# Altium schematic sheet Ethernet_Sheet.SchDoc (part 1 of 2)
size 420 x 297 mm; SheetNumber: 9; SheetTotal: 9
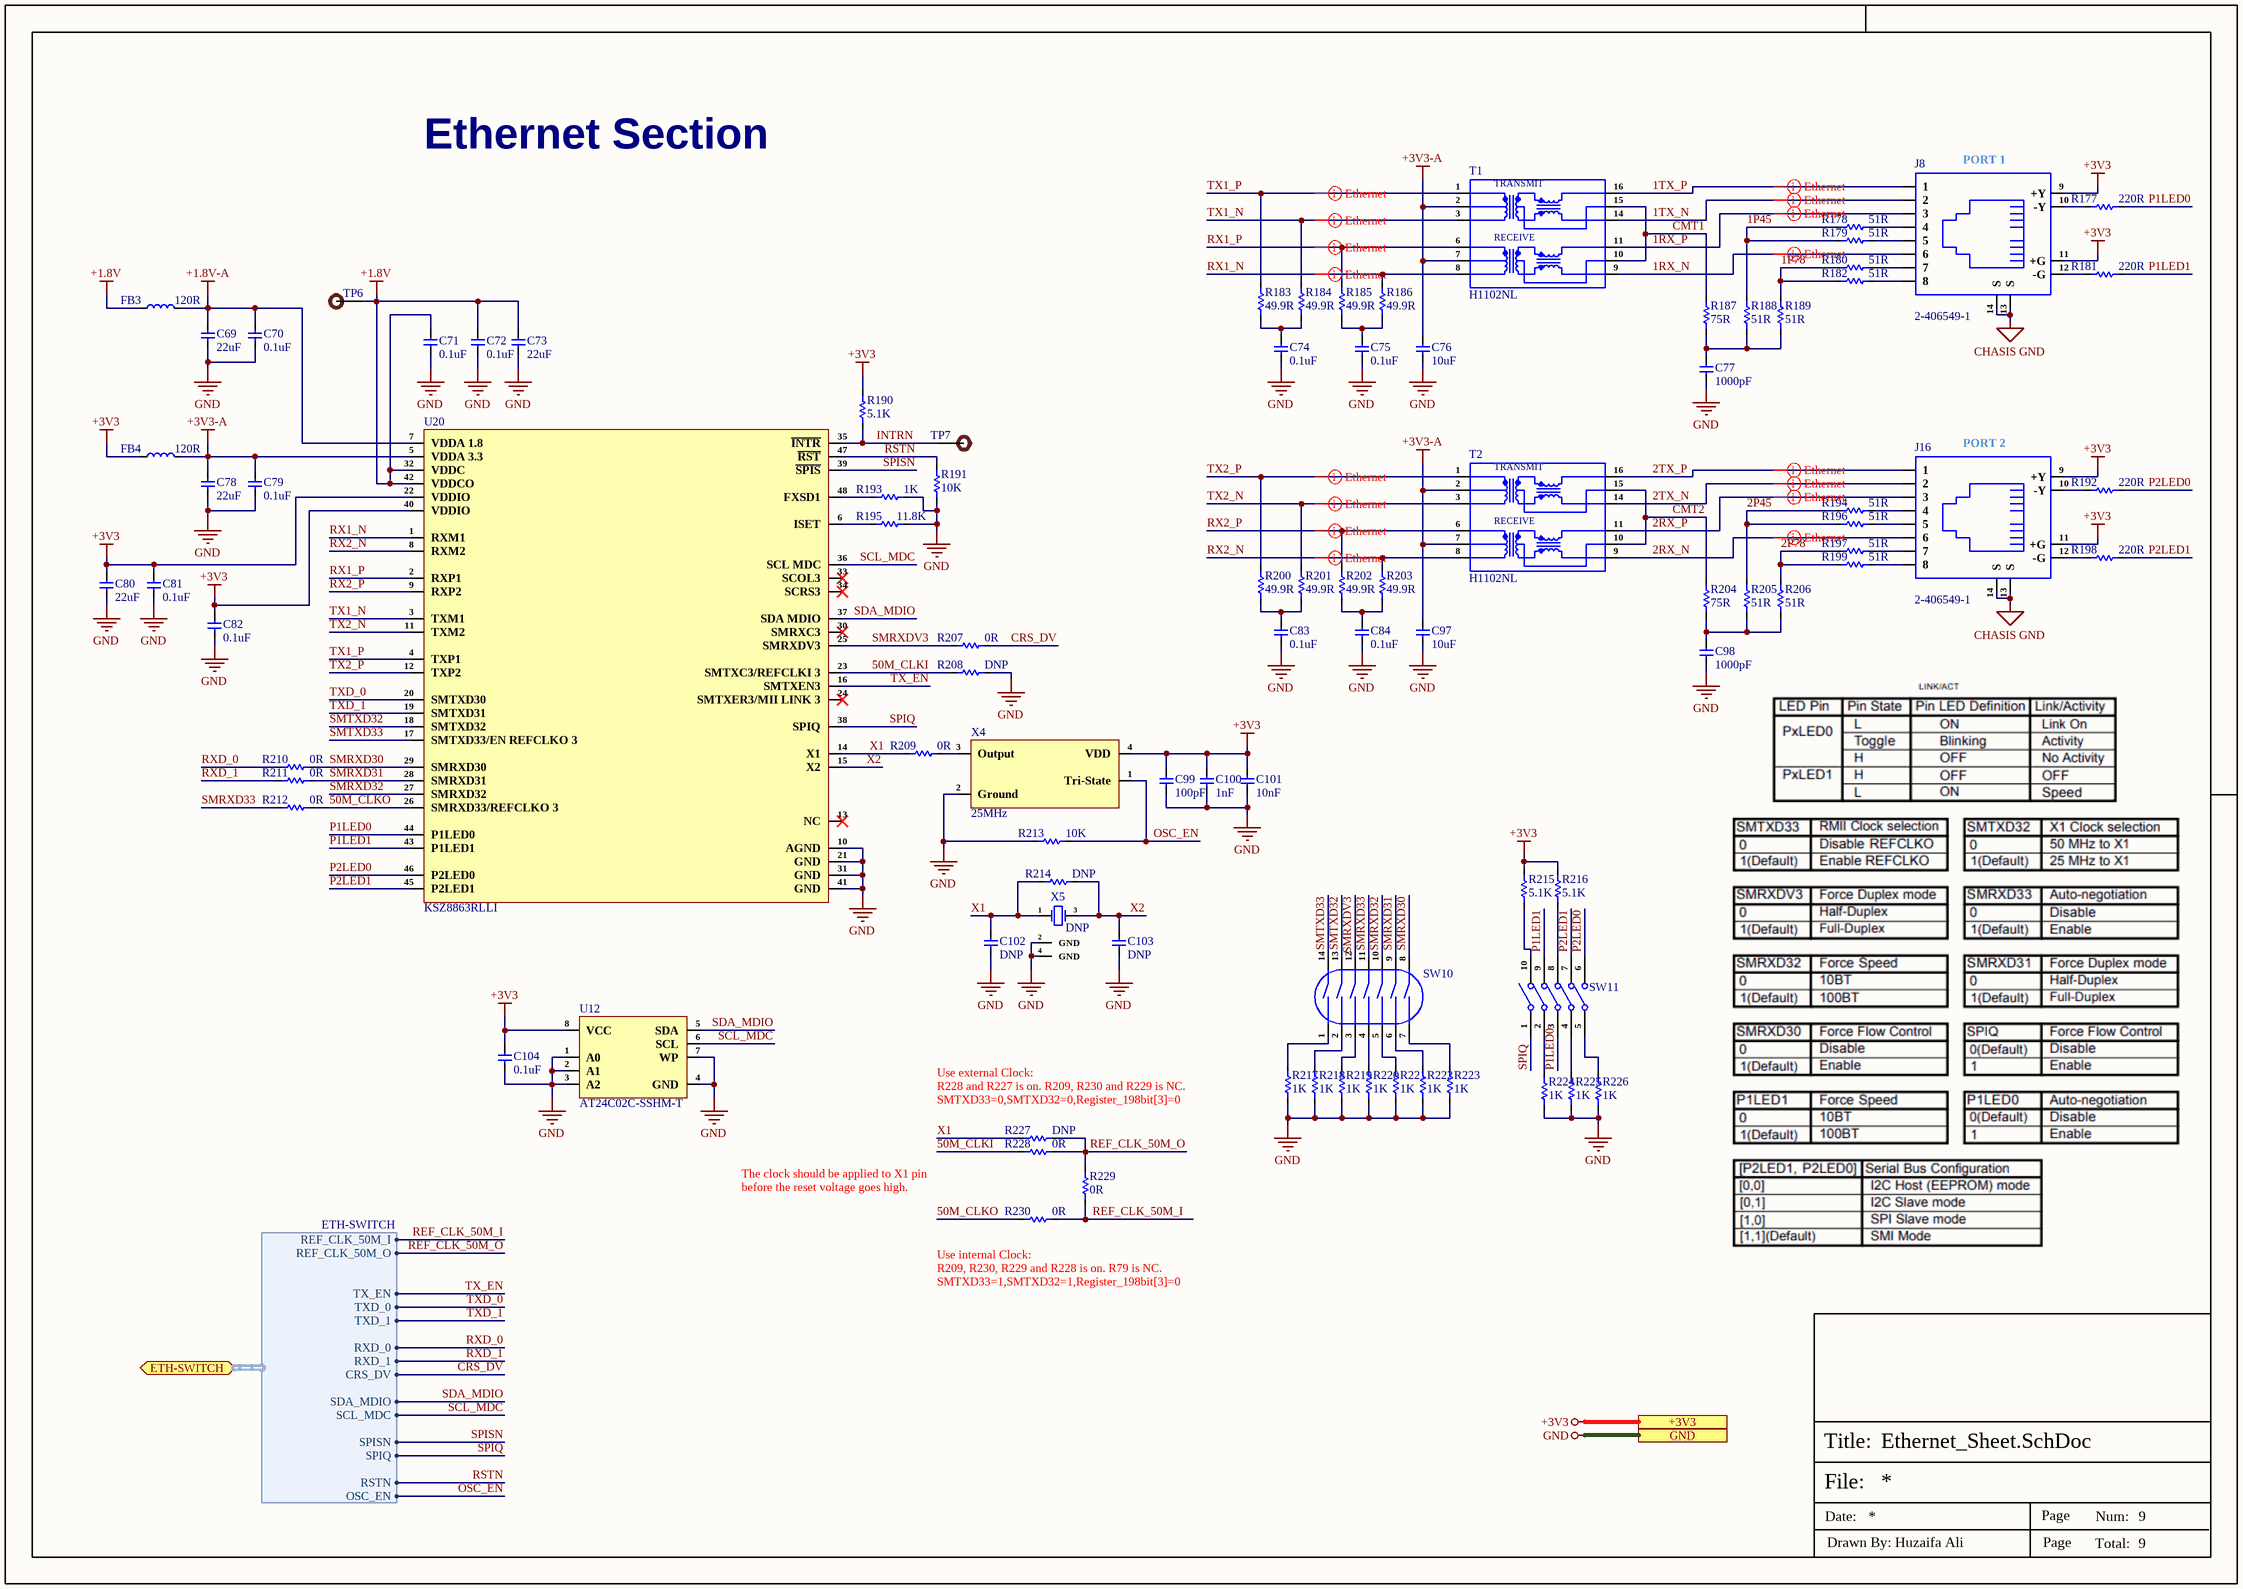
[diagram p0: Ethernet_Sheet.SchDoc]

## Parts
C69  22uF  [Cap-0805]
C70  0.1uF  [Cap-0402]
C71  0.1uF  [Cap-0402]
C72  0.1uF  [Cap-0402]
C73  22uF  [Cap-0805]
C74  0.1uF  [Cap-0402]
C75  0.1uF  [Cap-0402]
C76  10uF  [Cap-0603]
C77  1000pF  [Cap-1206]
C78  22uF  [Cap-0805]
C79  0.1uF  [Cap-0402]
C80  22uF  [Cap-0805]
C81  0.1uF  [Cap-0402]
C82  0.1uF  [Cap-0402]
C83  0.1uF  [Cap-0402]
C84  0.1uF  [Cap-0402]
C97  10uF  [Cap-0603]
C98  1000pF  [Cap-1206]
C99  100pF  [Cap-0402]
C100  1nF  [Cap-0402]
C101  10nF  [Cap-0402]
C102  DNP  [Cap-0402]
C103  DNP  [Cap-0402]
C104  0.1uF  [Cap-0402]
FB3  120R  [IND-0603 (1608 Metric)]
FB4  120R  [IND-0603 (1608 Metric)]
J8  2-406549-1  [2-406549-1]
J16  2-406549-1  [2-406549-1]
R177  220R  [Res-0603]
R178  51R  [Res-0603]
R179  51R  [Res-0603]
R180  51R  [Res-0603]
R181  220R  [Res-0603]
R182  51R  [Res-0603]
R183  49.9R  [Res-0603]
R184  49.9R  [Res-0603]
R185  49.9R  [Res-0603]
R186  49.9R  [Res-0603]
R187  75R  [Res-0603]
R188  51R  [Res-0603]
R189  51R  [Res-0603]
R190  5.1K  [Res-0402]
R191  10K  [Res-0402]
R192  220R  [Res-0603]
R193  1K  [Res-0402]
R194  51R  [Res-0603]
R195  11.8K  [Res-0603]
R196  51R  [Res-0603]
R197  51R  [Res-0603]
R198  220R  [Res-0603]
R199  51R  [Res-0603]
R200  49.9R  [Res-0603]
R201  49.9R  [Res-0603]
R202  49.9R  [Res-0603]
R203  49.9R  [Res-0603]
R204  75R  [Res-0603]
R205  51R  [Res-0603]
R206  51R  [Res-0603]
R207  0R  [Res-0402]
R208  DNP  [Res-0402]
R209  0R  [Res-0402]
R210  0R  [Res-0402]
R211  0R  [Res-0402]
R212  0R  [Res-0402]
R213  10K  [Res-0402]
R214  DNP  [Res-0402]
R215  5.1K  [Res-0402]
R216  5.1K  [Res-0402]
R217  1K  [Res-0402]
R218  1K  [Res-0402]
R219  1K  [Res-0402]
R220  1K  [Res-0402]
R221  1K  [Res-0402]
R222  1K  [Res-0402]
R223  1K  [Res-0402]
R224  1K  [Res-0402]
R225  1K  [Res-0402]
R226  1K  [Res-0402]
R227  DNP  [Res-0402]
R228  0R  [Res-0402]
R229  0R  [Res-0402]
R230  0R  [Res-0402]
SW10  DSIC07LS-P  [DSIC07LS-P]  (value not drawn)
SW11  DSIC05LS-P  [DSIC05LS-P_]  (value not drawn)
T1  H1102NL  [H1102NLT]
T2  H1102NL  [H1102NLT]
TP6  TEST POINT 0.5mm Dia  [Test-point - 0.5mm]  (value not drawn)  (no BOM)
TP7  TEST POINT 0.5mm Dia  [Test-point - 0.5mm]  (value not drawn)  (no BOM)
U12  AT24C02C-SSHM-T  [SOIC-8(0.154", 3.90mm Width)]
U20  KSZ8863RLLI  [48-LQFP (7x7)]
X4  25MHz  [SMD2520-4P]
X5  DNP  [Q22FA12800090]

## Ports
+3V3 (see Top-Sheet[2B], CAN_Sheet[5D], ESP32_Sheet[5D], EtherCAT_Sheet[5D], Power_Sheet[5D], RS485_RS232_Sheet[5D], STM32_Sheet[5D], TFT_Display_Sheet[5D]), ETH-SWITCH (bidir, harness ETH-SWITCH, see Top-Sheet[2B], ESP32_Sheet[1D]), GND (see Top-Sheet[2B], CAN_Sheet[5D], ESP32_Sheet[5D], EtherCAT_Sheet[5D], Power_Sheet[5D], RS485_RS232_Sheet[5D], STM32_Sheet[5D], TFT_Display_Sheet[5D])

## Harnesses
ETH-SWITCH: REF_CLK_50M_I, REF_CLK_50M_O, TX_EN, TXD_0, TXD_1, RXD_0, RXD_1, CRS_DV, SDA_MDIO, SCL_MDC, SPISN, SPIQ, RSTN, OSC_EN

## Nets
+1.8V: C71.2 C72.2 C73.2 FB3.1 TP6.1 U20.32(VDDC) U20.42(VDDCO)
+1.8V-A: C69.2 C70.2 FB3.2 U20.7(VDDA_1.8)
+3V3: C80.2 C81.2 C82.2 C99.2 C100.2 C101.2 C104.2 FB4.1 J8.9(+Y) J8.11(+G) J16.9(+Y) J16.11(+G) R190.2 R215.2 R216.2 U12.8(VCC) U20.22(VDDIO) U20.40(VDDIO) X4.4(VDD) ; port +3V3
+3V3-A: C76.2 C78.2 C79.2 C97.2 FB4.2 T1.2 T1.7 T2.2 T2.7 U20.5(VDDA_3.3)
CHASIS GND: J8.13(S) J8.14(S) J16.13(S) J16.14(S)
GND: C69.1 C70.1 C71.1 C72.1 C73.1 C74.1 C75.1 C76.1 C77.1 C78.1 C79.1 C80.1 C81.1 C82.1 C83.1 C84.1 C97.1 C98.1 C99.1 C100.1 C101.1 C102.1 C103.1 C104.1 R191.1 R193.1 R195.2 R208.2 R213.1 R217.1 R218.1 R219.1 R220.1 R221.1 R222.1 R223.1 R224.1 R225.1 R226.1 U12.1(A0) U12.2(A1) U12.3(A2) U12.4(GND) U12.7(WP) U20.10(AGND) U20.21(GND) U20.31(GND) U20.41(GND) X4.2(Ground) X5.2(GND) X5.4(GND) ; port GND
1P45: R178.2 R179.2 R188.2
1P78: R180.2 R182.2 R189.2
1RX_N: J8.6 T1.9
1RX_P: J8.3 T1.11
1TX_N: J8.2 T1.14
1TX_P: J8.1 T1.16
2P45: R194.2 R196.2 R205.2
2P78: R197.2 R199.2 R206.2
2RX_N: J16.6 T2.9
2RX_P: J16.3 T2.11
2TX_N: J16.2 T2.14
2TX_P: J16.1 T2.16
50M_CLKI: R208.1 R228.1 U20.23(SMTXC3/REFCLKI_3)
50M_CLKO: R212.2 R230.1 U20.26(SMRXD33/REFCLKO_3)
CMT1: R187.2 T1.10 T1.15
CMT2: R204.2 T2.10 T2.15
CRS_DV: R207.2 ; port ETH-SWITCH.CRS_DV
INTRN: R190.1 TP7.1 U20.35(~{INTR})
OSC_EN: R213.2 X4.1(Tri-State) ; port ETH-SWITCH.OSC_EN
P1LED0: R177.2 SW11.3 U20.44(P1LED0)
P1LED1: R181.2 SW11.9 U20.43(P1LED1)
P2LED0: R192.2 SW11.6 U20.46(P2LED0)
P2LED1: R198.2 SW11.7 U20.45(P2LED1)
REF_CLK_50M_I: R229.1 R230.2 ; port ETH-SWITCH.REF_CLK_50M_I
REF_CLK_50M_O: R227.2 R228.2 R229.2 ; port ETH-SWITCH.REF_CLK_50M_O
RSTN: R191.2 U20.47(~{RST}) ; port ETH-SWITCH.RSTN
RX1_N: R186.2 T1.8 U20.1(RXM1)
RX1_P: R185.2 T1.6 U20.2(RXP1)
RX2_N: R203.2 T2.8 U20.8(RXM2)
RX2_P: R202.2 T2.6 U20.9(RXP2)
RXD_0: R210.1 ; port ETH-SWITCH.RXD_0
RXD_1: R211.1 ; port ETH-SWITCH.RXD_1
SCL_MDC: U12.6(SCL) U20.36(SCL_MDC) ; port ETH-SWITCH.SCL_MDC
SDA_MDIO: U12.5(SDA) U20.37(SDA_MDIO) ; port ETH-SWITCH.SDA_MDIO
SMRXD30: R210.2 SW10.8 U20.29(SMRXD30)
SMRXD31: R211.2 SW10.9 U20.28(SMRXD31)
SMRXD32: SW10.10 U20.27(SMRXD32)
SMRXD33: R212.1 SW10.11
SMRXDV3: R207.1 SW10.12 U20.25(SMRXDV3)
SMTXD32: SW10.13 U20.18(SMTXD32)
SMTXD33: SW10.14 U20.17(SMTXD33/EN_REFCLKO_3)
SPIQ: SW11.1 U20.38(SPIQ) ; port ETH-SWITCH.SPIQ
SPISN: U20.39(~{SPIS}) ; port ETH-SWITCH.SPISN
TX1_N: R184.2 T1.3 U20.3(TXM1)
TX1_P: R183.2 T1.1 U20.4(TXP1)
TX2_N: R201.2 T2.3 U20.11(TXM2)
TX2_P: R200.2 T2.1 U20.12(TXP2)
TX_EN: U20.16(SMTXEN3) ; port ETH-SWITCH.TX_EN
TXD_0: U20.20(SMTXD30) ; port ETH-SWITCH.TXD_0
TXD_1: U20.19(SMTXD31) ; port ETH-SWITCH.TXD_1
X1: C102.2 R209.1 R214.1 R227.1 U20.14(X1) X5.1(OSC1)
X2: C103.2 R214.2 U20.15(X2) X5.3(OSC2)
NetC74_2: C74.2 R183.1 R184.1
NetC75_2: C75.2 R185.1 R186.1
NetC77_2: C77.2 R187.1 R188.1 R189.1
NetC83_2: C83.2 R200.1 R201.1
NetC84_2: C84.2 R202.1 R203.1
NetC98_2: C98.2 R204.1 R205.1 R206.1
NetJ8_4: J8.4 R178.1
NetJ8_5: J8.5 R179.1
NetJ8_7: J8.7 R180.1
NetJ8_8: J8.8 R182.1
NetJ8_10: J8.10(-Y) R177.1
NetJ8_12: J8.12(-G) R181.1
NetJ16_4: J16.4 R194.1
NetJ16_5: J16.5 R196.1
NetJ16_7: J16.7 R197.1
NetJ16_8: J16.8 R199.1
NetJ16_10: J16.10(-Y) R192.1
NetJ16_12: J16.12(-G) R198.1
NetR193_2: R193.2 U20.48(FXSD1)
NetR195_1: R195.1 U20.6(ISET)
NetR209_2: R209.2 X4.3(Output)
NetR215_1: R215.1 SW11.10
NetR216_1: R216.1 SW11.8
NetR217_2: R217.2 SW10.1
NetR218_2: R218.2 SW10.2
NetR219_2: R219.2 SW10.3
NetR220_2: R220.2 SW10.4
NetR221_2: R221.2 SW10.5
NetR222_2: R222.2 SW10.6
NetR223_2: R223.2 SW10.7
NetR224_2: R224.2 SW11.2
NetR225_2: R225.2 SW11.4
NetR226_2: R226.2 SW11.5

Not connected (* = marked no-connect by the designer): U20 13(NC)* 24(SMTXER3/MII_LINK_3)* 30(SMRXC3)* 33(SCOL3)* 34(SCRS3)*

## Layout directives
differential pair; differential pair class Ethernet-1 A Lines; rule Impedance Constraint [Min = 97.00    Max = 103.0    ]; rule Matched Net Lengths [Tolerance = 0.508mm]: 1RX_N, 1RX_P, 1TX_N, 1TX_P
differential pair; differential pair class Ethernet-1 B Lines; rule Impedance Constraint [Min = 97.00    Max = 103.0    ]; rule Matched Net Lengths [Tolerance = 0.508mm]: RX1_N, RX1_P, TX1_N, TX1_P
differential pair; differential pair class Ethernet-2 A Lines; rule Impedance Constraint [Min = 97.00    Max = 103.0    ]; rule Matched Net Lengths [Tolerance = 0.508mm]: 2RX_N, 2RX_P, 2TX_N, 2TX_P
differential pair; differential pair class Ethernet-2 B Lines; rule Impedance Constraint [Min = 97.00    Max = 103.0    ]; rule Matched Net Lengths [Tolerance = 0.508mm]: RX2_N, RX2_P, TX2_N, TX2_P

## Notes on the sheet
- Ethernet Section
- (near J8) PORT 1
- (near J16) PORT 2
- Use external Clock:
  R228 and R227 is on. R209, R230 and R229 is NC.
  SMTXD33=0,SMTXD32=0,Register_198bit[3]=0
- The clock should be applied to X1 pin before the reset voltage goes high.
- (near R230) Use internal Clock:
  R209, R230, R229 and R228 is on. R79 is NC.
  SMTXD33=1,SMTXD32=1,Register_198bit[3]=0
- File:
- Title:
- Date:
- Page
- Num:
- Total:
- Drawn By: Huzaifa Ali
- (in symbol H1102NL) TRANSMIT; RECEIVE